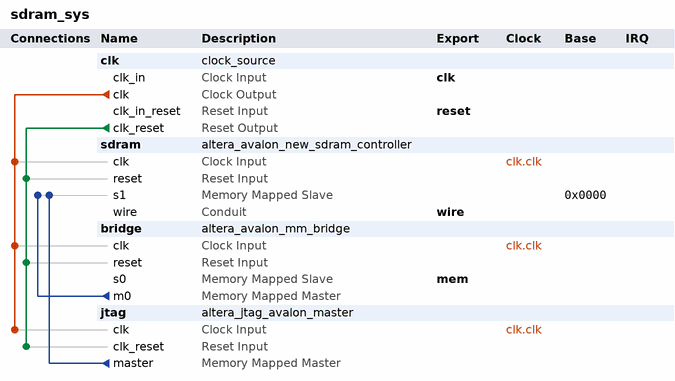
[diagram p0: system contents]
# Platform Designer (Qsys) system sdram_sys, MAX 10 10M50DAF484C7G
# Parameters at their usual value, and those the tool derives, are not listed.
package require -exact qsys 20.1
create_system sdram_sys
set_project_property DEVICE_FAMILY {MAX 10}
set_project_property DEVICE 10M50DAF484C7G

add_instance clk clock_source 20.1
set_instance_parameter_value clk clockFrequency 25000000
set_instance_parameter_value clk resetSynchronousEdges DEASSERT

add_instance sdram altera_avalon_new_sdram_controller 20.1
set_instance_parameter_value sdram TAC 6.0
set_instance_parameter_value sdram TRCD 20.0
set_instance_parameter_value sdram TRP 20.0
set_instance_parameter_value sdram casLatency 2
set_instance_parameter_value sdram columnWidth 10
set_instance_parameter_value sdram dataWidth 16
set_instance_parameter_value sdram generateSimulationModel true
set_instance_parameter_value sdram model single_Micron_MT48LC4M32B2_7_chip
set_instance_parameter_value sdram numberOfBanks 4
set_instance_parameter_value sdram numberOfChipSelects 1
set_instance_parameter_value sdram powerUpDelay 100.0
set_instance_parameter_value sdram refreshPeriod 7.8125
set_instance_parameter_value sdram rowWidth 13

add_instance bridge altera_avalon_mm_bridge 20.1
set_instance_parameter_value bridge ADDRESS_UNITS SYMBOLS
set_instance_parameter_value bridge ADDRESS_WIDTH 26
set_instance_parameter_value bridge DATA_WIDTH 32
set_instance_parameter_value bridge MAX_PENDING_RESPONSES 4
set_instance_parameter_value bridge PIPELINE_COMMAND 0
set_instance_parameter_value bridge PIPELINE_RESPONSE 0
set_instance_parameter_value bridge USE_AUTO_ADDRESS_WIDTH 0

add_instance jtag altera_jtag_avalon_master 20.1

# connections
add_connection clk.clk bridge.clk clock
add_connection clk.clk jtag.clk clock
add_connection clk.clk sdram.clk clock
add_connection clk.clk_reset bridge.reset reset
add_connection clk.clk_reset jtag.clk_reset reset
add_connection clk.clk_reset sdram.reset reset
add_connection bridge.m0 sdram.s1 avalon
set_connection_parameter_value bridge.m0/sdram.s1 baseAddress 0x0000
add_connection jtag.master sdram.s1 avalon
set_connection_parameter_value jtag.master/sdram.s1 baseAddress 0x0000

# exported interfaces
add_interface clk clock sink
set_interface_property clk EXPORT_OF clk.clk_in
add_interface mem avalon slave
set_interface_property mem EXPORT_OF bridge.s0
add_interface reset reset sink
set_interface_property reset EXPORT_OF clk.clk_in_reset
add_interface wire conduit end
set_interface_property wire EXPORT_OF sdram.wire

set_interconnect_requirement {$system} qsys_mm.clockCrossingAdapter HANDSHAKE
set_interconnect_requirement {$system} qsys_mm.enableEccProtection FALSE
set_interconnect_requirement {$system} qsys_mm.insertDefaultSlave FALSE
set_interconnect_requirement {$system} qsys_mm.maxAdditionalLatency 1

save_system sdram_sys.qsys
